# Altium schematic sheet CW341_FPGAIO_4.SchDoc: Kintex IO Banks
size Letter; Organization: NewAE Technology Inc.; Address1: 1083 Queen St., Suite 196; Address2: Halifax; Address3: NS; Address4: Canada B3H 0B2; SheetNumber: 9; SheetTotal: 16; SheetApproved: YES
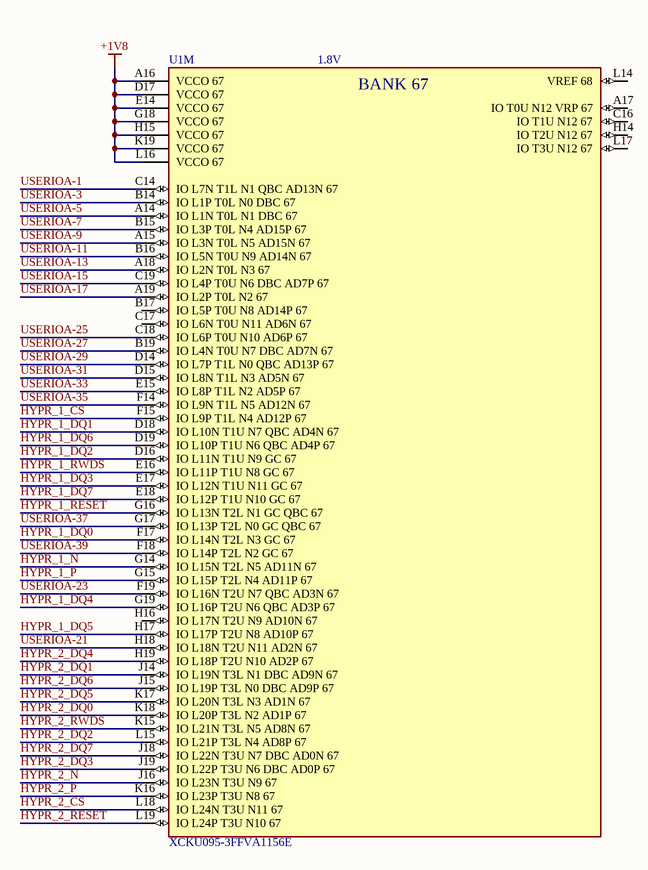
[diagram p0: CW341_FPGAIO_4.SchDoc]

## Parts
U1  XCKU095-3FFVA1156E  [FP-XCKU060-3FFVA1156E-MFG]  (part M of 23)

## Nets
+1V8: U1.A16(VCCO_67) U1.D17(VCCO_67) U1.E14(VCCO_67) U1.G18(VCCO_67) U1.H15(VCCO_67) U1.K19(VCCO_67) U1.L16(VCCO_67)
HYPR_1_~{CS}: U1.F15(IO_L9P_T1L_N4_AD12P_67)
HYPR_1_DQ0: U1.F17(IO_L14N_T2L_N3_GC_67)
HYPR_1_DQ1: U1.D18(IO_L10N_T1U_N7_QBC_AD4N_67)
HYPR_1_DQ2: U1.D16(IO_L11N_T1U_N9_GC_67)
HYPR_1_DQ3: U1.E17(IO_L12N_T1U_N11_GC_67)
HYPR_1_DQ4: U1.G19(IO_L16P_T2U_N6_QBC_AD3P_67)
HYPR_1_DQ5: U1.H17(IO_L17P_T2U_N8_AD10P_67)
HYPR_1_DQ6: U1.D19(IO_L10P_T1U_N6_QBC_AD4P_67)
HYPR_1_DQ7: U1.E18(IO_L12P_T1U_N10_GC_67)
HYPR_1_N: U1.G14(IO_L15N_T2L_N5_AD11N_67)
HYPR_1_P: U1.G15(IO_L15P_T2L_N4_AD11P_67)
HYPR_1_~{RESET}: U1.G16(IO_L13N_T2L_N1_GC_QBC_67)
HYPR_1_RWDS: U1.E16(IO_L11P_T1U_N8_GC_67)
HYPR_2_~{CS}: U1.L18(IO_L24N_T3U_N11_67)
HYPR_2_DQ0: U1.K18(IO_L20P_T3L_N2_AD1P_67)
HYPR_2_DQ1: U1.J14(IO_L19N_T3L_N1_DBC_AD9N_67)
HYPR_2_DQ2: U1.L15(IO_L21P_T3L_N4_AD8P_67)
HYPR_2_DQ3: U1.J19(IO_L22P_T3U_N6_DBC_AD0P_67)
HYPR_2_DQ4: U1.H19(IO_L18P_T2U_N10_AD2P_67)
HYPR_2_DQ5: U1.K17(IO_L20N_T3L_N3_AD1N_67)
HYPR_2_DQ6: U1.J15(IO_L19P_T3L_N0_DBC_AD9P_67)
HYPR_2_DQ7: U1.J18(IO_L22N_T3U_N7_DBC_AD0N_67)
HYPR_2_N: U1.J16(IO_L23N_T3U_N9_67)
HYPR_2_P: U1.K16(IO_L23P_T3U_N8_67)
HYPR_2_~{RESET}: U1.L19(IO_L24P_T3U_N10_67)
HYPR_2_RWDS: U1.K15(IO_L21N_T3L_N5_AD8N_67)
USERIOA-1: U1.C14(IO_L7N_T1L_N1_QBC_AD13N_67)
USERIOA-3: U1.B14(IO_L1P_T0L_N0_DBC_67)
USERIOA-5: U1.A14(IO_L1N_T0L_N1_DBC_67)
USERIOA-7: U1.B15(IO_L3P_T0L_N4_AD15P_67)
USERIOA-9: U1.A15(IO_L3N_T0L_N5_AD15N_67)
USERIOA-11: U1.B16(IO_L5N_T0U_N9_AD14N_67)
USERIOA-13: U1.A18(IO_L2N_T0L_N3_67)
USERIOA-15: U1.C19(IO_L4P_T0U_N6_DBC_AD7P_67)
USERIOA-17: U1.A19(IO_L2P_T0L_N2_67)
USERIOA-21: U1.H18(IO_L18N_T2U_N11_AD2N_67)
USERIOA-23: U1.F19(IO_L16N_T2U_N7_QBC_AD3N_67)
USERIOA-25: U1.C18(IO_L6P_T0U_N10_AD6P_67)
USERIOA-27: U1.B19(IO_L4N_T0U_N7_DBC_AD7N_67)
USERIOA-29: U1.D14(IO_L7P_T1L_N0_QBC_AD13P_67)
USERIOA-31: U1.D15(IO_L8N_T1L_N3_AD5N_67)
USERIOA-33: U1.E15(IO_L8P_T1L_N2_AD5P_67)
USERIOA-35: U1.F14(IO_L9N_T1L_N5_AD12N_67)
USERIOA-37: U1.G17(IO_L13P_T2L_N0_GC_QBC_67)
USERIOA-39: U1.F18(IO_L14P_T2L_N2_GC_67)

Not connected (* = marked no-connect by the designer): U1 A17(IO_T0U_N12_VRP_67) B17(IO_L5P_T0U_N8_AD14P_67) C16(IO_T1U_N12_67) C17(IO_L6N_T0U_N11_AD6N_67) H14(IO_T2U_N12_67) H16(IO_L17N_T2U_N9_AD10N_67) L14(VREF_68) L17(IO_T3U_N12_67)

## Notes on the sheet
- (near U1) 1.8V
- Title:
- Date:
- Rev:
- Time:
- Project:
- Sheet
- of
- License:
- Copyright © NewAE Technology Inc.
- Approved:
- NewAE.com
- File:
- (in symbol IC-XCKU095-1156, part M) BANK 67

## Library data of the parts
U1 = IC-XCKU095-1156: IC FPGA 520 I/O 1156FCBGA; Manufacturer: Xilinx; Manufacturer Part Number: XCKU060-3FFVA1156E; Standoff Height: 0.4mm; Ram Size: 38MBytes; Min Supply Voltage: 0.97V; Max Junction Temp: +100°C; Max Supply Voltage: 1.8V; Number Of Logic Elements Cells: 1176000; Number Of I/Os: 520; Speed Grade: 3; Memory Type: RAM; Ipc Land Pattern Name: BGA1156N100P34X34_3500X3500X342; RoHS: TRUE; Height: 3.51mm; Footprint Url: https://www.xilinx.com/support/documentation/user_guides/ug575-ultrascale-pkg-pinout.pdf; Device Class L2: Embedded Processors and Controllers; ComponentLink2URL: https://www.xilinx.com/support/documentation/data_sheets/ds890-ultrascale-overview.pdf; Temperature Range High: +100°C; Device Class L1: Integrated Circuits (ICs); Package: 0; Octopart: https://octopart.com/xcku035-3ffva1156e-xilinx-67038192?r=sp; Automotive: No; ComponentLink2Description: Datasheet; Device Class L3: FPGAs - Field Programmable Gate Arrays; Category: IC; Lead Free: Yes; Temperature: 0°C to +100°C; Temperature Range Low: 0°C; Digikey Description: IC FPGA 520 I/O 1156FCBGA